# Altium schematic sheet ORing.SchDoc
size A4; SheetNumber: 2; SheetTotal: 7
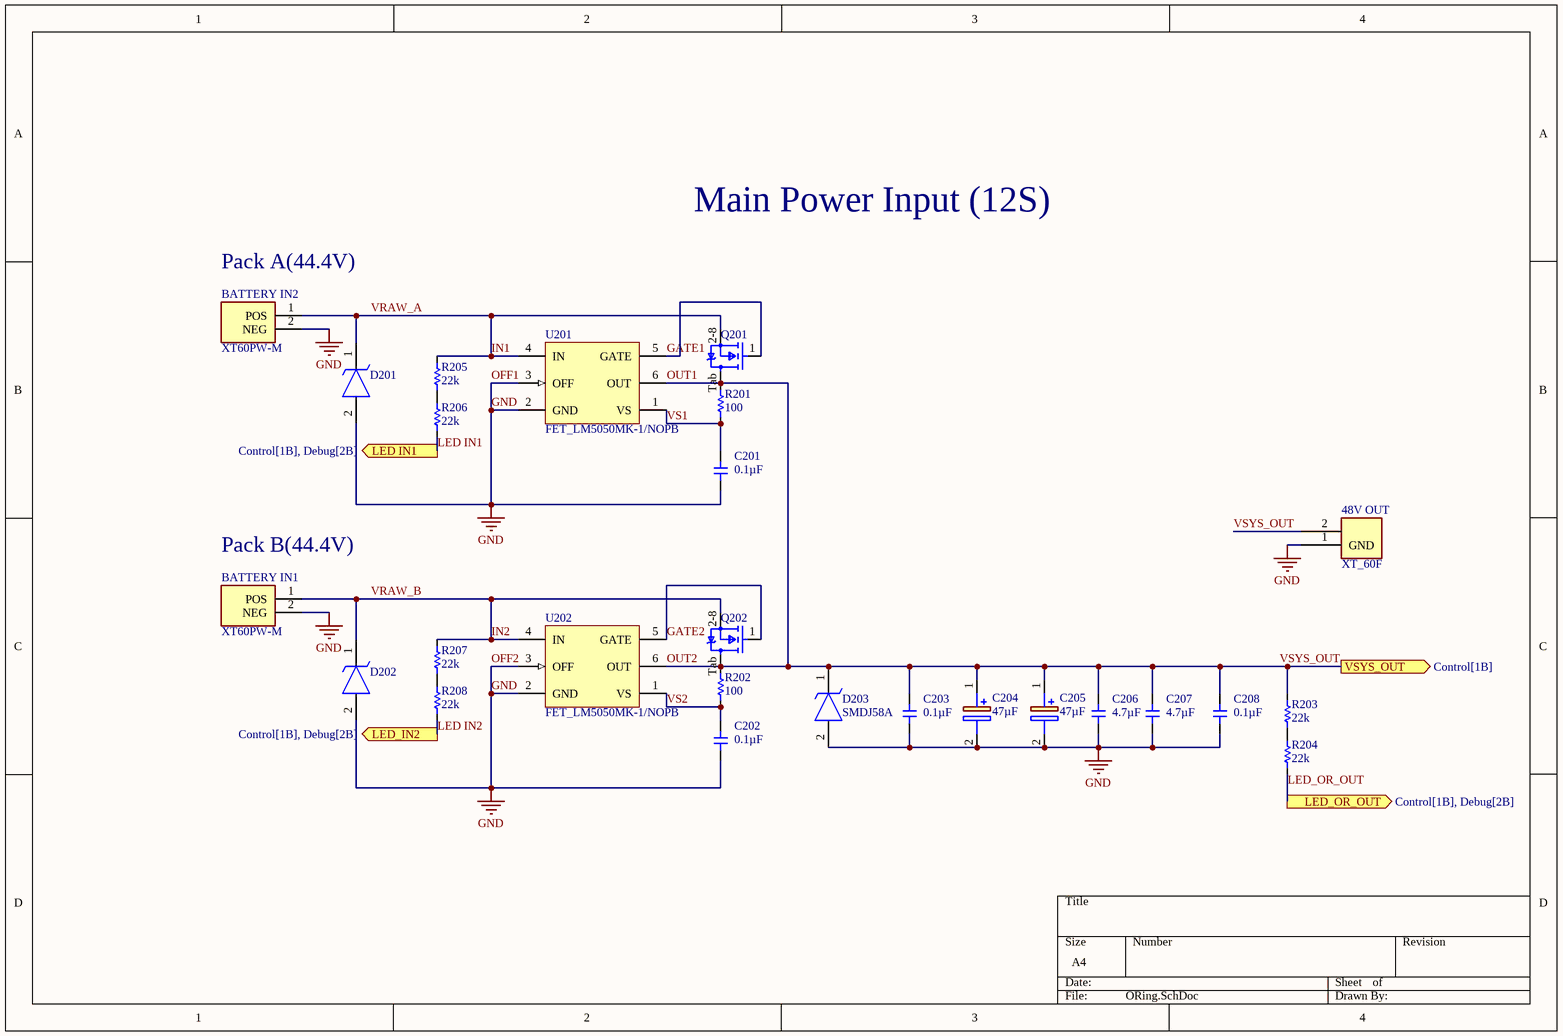
[diagram p0: ORing.SchDoc]

## Parts
48V_OUT  XT_60F  [XT60_F]
BATTERY_IN1  XT60PW-M  [XT60PW-M]
BATTERY_IN2  XT60PW-M  [XT60PW-M]
C201  Capacitance: 0.1µF  [C0603]  (hidden comment: C_0603_0P1UF_10P_100V_X7R)
C202  Capacitance: 0.1µF  [C0603]  (hidden comment: C_0603_0P1UF_10P_100V_X7R)
C203  Capacitance: 0.1µF  [C0603]  (hidden comment: C_0603_0P1UF_10P_100V_X7R)
C204  47µF  [CAPAE1030X1050N]
C205  47µF  [CAPAE1030X1050N]
C206  Capacitance: 4.7µF  [C1210]  (hidden comment: C_1210_4U7F_10P_100V_X7R)
C207  Capacitance: 4.7µF  [C1210]  (hidden comment: C_1210_4U7F_10P_100V_X7R)
C208  Capacitance: 0.1µF  [C0603]  (hidden comment: C_0603_0P1UF_10P_100V_X7R)
D201  SMDJ58A  [DIONM7959X262N]  (value not drawn)
D202  SMDJ58A  [DIONM7959X262N]  (value not drawn)
D203  SMDJ58A  [DIONM7959X262N]
Q201  Trans_Infineon_IPT015N10N5_eec  [Infineon_IPT015N10N5_0]  (value not drawn)
Q202  Trans_Infineon_IPT015N10N5_eec  [Infineon_IPT015N10N5_0]  (value not drawn)
R201  Resistance: 100  [R0603]  (hidden comment: R_0603_100R_1P_0P1W)
R202  Resistance: 100  [R0603]  (hidden comment: R_0603_100R_1P_0P1W)
R203  Resistance: 22k  [R0603]  (hidden comment: R_0603_22K_1P_0P1W)
R204  Resistance: 22k  [R0603]  (hidden comment: R_0603_22K_1P_0P1W)
R205  Resistance: 22k  [R0603]  (hidden comment: R_0603_22K_1P_0P1W)
R206  Resistance: 22k  [R0603]  (hidden comment: R_0603_22K_1P_0P1W)
R207  Resistance: 22k  [R0603]  (hidden comment: R_0603_22K_1P_0P1W)
R208  Resistance: 22k  [R0603]  (hidden comment: R_0603_22K_1P_0P1W)
U201  FET_LM5050MK-1/NOPB  [DDC0006A_M]
U202  FET_LM5050MK-1/NOPB  [DDC0006A_M]

## Ports
LED IN1 (out, see Control[1B], Debug[2B]), LED_IN2 (out, see Control[1B], Debug[2B]), LED_OR_OUT (out, see Control[1B], Debug[2B]), VSYS_OUT (out, see Control[1B])

## Nets
GND: 48V_OUT.1(GND) BATTERY_IN1.2(NEG) BATTERY_IN2.2(NEG) C201.1 C202.1 C203.1 C204.2(-) C205.2(-) C206.1 C207.1 C208.1 D201.2(A) D202.2(A) D203.2(A) U201.2(GND) U201.3(OFF) U202.2(GND) U202.3(OFF)  [also labelled OFF1, OFF2]
GATE1: Q201.1(Gate) U201.5(GATE)
GATE2: Q202.1(Gate) U202.5(GATE)
IN1: BATTERY_IN2.1(POS) D201.1(K) Q201.2-8(Source) R205.2 U201.4(IN)  [also labelled VRAW_A]
IN2: BATTERY_IN1.1(POS) D202.1(K) Q202.2-8(Source) R207.2 U202.4(IN)  [also labelled VRAW_B]
LED IN1: R206.1 ; port LED IN1
LED IN2: R208.1 ; port LED_IN2
LED_OR_OUT: R204.1 ; port LED_OR_OUT
OUT1: 48V_OUT.2 C203.2 C204.1(+) C205.1(+) C206.2 C207.2 C208.2 D203.1(K) Q201.Tab(Drain) Q202.Tab(Drain) R201.2 R202.2 R203.2 U201.6(OUT) U202.6(OUT) ; port VSYS_OUT  [also labelled OUT2, VSYS_OUT]
VS1: C201.2 R201.1 U201.1(VS)
VS2: C202.2 R202.1 U202.1(VS)
NetR203_1: R203.1 R204.2
NetR205_1: R205.1 R206.2
NetR207_1: R207.1 R208.2

## Notes on the sheet
- Main Power Input (12S)
- (near BATTERY_IN2) Pack A(44.4V)
- (near BATTERY_IN1) Pack B(44.4V)

## Library data of the parts
48V_OUT = CMP-019-000041-2: XT_60 Connector FEMAIL; Design Item ID: XT_60F; Source: robit_connector.SchLib; System: Connector
BATTERY_IN1 BATTERY_IN2 = CMP-019-000059-3: Socket, DC supply, male, PIN: 2; MF: AMASS; System: Connector; Package: Package; SnapEDA_Link: https://www.snapeda.com/parts/XT60PW-M/AMASS/view-part/?ref=snap; Design Item ID: XT60PW-M; Check_prices: https://www.snapeda.com/parts/XT60PW-M/AMASS/view-part/?ref=eda; MP: XT60PW-M; Price: None; Availability: Not in stock; Source: robit_connector.SchLib; Value: *
C201-C203 C208 = CMP-00021-3: MLCC, 0.1µF, 10%, 100V, X7R, 0603; Dielectric: X7R; Mounting Type: SMD; Tolerance: 10%; Package: 0603; Voltage Rating: 100V
C204 C205 = UUX2A470MNL1GS: Capacitor Polarised; Manufacturer_Name: Nichicon; Datasheet Link: https://componentsearchengine.com/Datasheets/1/UUX2A470MNL1GS.pdf; Height: 10.5mm; Manufacturer_Part_Number: UUX2A470MNL1GS; Mouser Part Number: 647-UUX2A470MNL1GS; Mouser Price/Stock: https://www.mouser.co.uk/ProductDetail/Nichicon/UUX2A470MNL1GS?qs=jZZh9D7uMhmPZMofMKn2Fg%3D%3D; Arrow Part Number: UUX2A470MNL1GS; Arrow Price/Stock: https://www.arrow.com/en/products/uux2a470mnl1gs/nichicon?utm_currency=USD&region=nac
C206 C207 = CMP-00065-1: MLCC, 4.7µF, 10%, 100V, X7R, 1210; Package: 1210; Tolerance: 10%; Dielectric: X7R; Voltage Rating: 100V; Mounting Type: SMD
D201-D203 = SMDJ58A: TVS Diode (Uni-directional); Manufacturer_Name: LITTELFUSE; Datasheet Link: https://mouser.componentsearchengine.com/Datasheets/2/SMDJ58A.pdf; Height: 2.62mm; Manufacturer_Part_Number: SMDJ58A; Mouser Part Number: 576-SMDJ58A; Mouser Price/Stock: https://www.mouser.co.uk/ProductDetail/Littelfuse/SMDJ58A?qs=zL8PTTxXkF2zAaoXCy3ytQ%3D%3D; Arrow Part Number: SMDJ58A; Arrow Price/Stock: https://www.arrow.com/en/products/smdj58a/littelfuse?utm_currency=USD&region=nac
Q201 Q202 = Trans_Infineon_IPT015N10N5_eec: TRANS MOSFET N-CH 100V 300A 8HSOF; Part Number: IPT015N10N5; helpURL: https://upverter.com/upn/revision/59ddb1136ed40b7f/; ComponentLink2Description: Datasheet; Temperature: -55°C to +175°C; Package: HSOF8; Supplier 2: Mouser; Supplier 1: Digi-Key; ComponentLink1URL: https://upverter.com/upn/revision/59ddb1136ed40b7f/; Supplier Part Number 2: 726-IPT015N10N5ATMA1; Supplier Part Number 1: IPT015N10N5ATMA1CT-ND; Manufacturer: Infineon; ComponentLink1Description: Upverter; ComponentLink2URL: http://www.infineon.com/dgdl/Infineon-IPT015N10N5-DS-v02_02-EN.pdf?fileId=5546d4624a75e5f1014ac94680661aff; RoHS: TRUE; Mouser Part Number: 726-IPT015N10N5ATMA1; Temperature Range High: +175°C; Digikey Description: TRANS MOSFET N-CH 100V 300A 8HSOF; Digikey Part Number: IPT015N10N5ATMA1CT-ND; Lead Free: yes; Temperature Range Low: -55°C
R201 R202 = CMP-00048-1: Chip resistor, 100 Ohm, 1%, 0.1W, 0603; Voltage Rating: 75V; Power Rating: 100mW; Tolerance: 1%; Mounting Type: SMD; Package: 0603
R203-R208 = CMP-00064-1: Chip resistor, 22k Ohm, 1%, 0.1W, 0603; Power Rating: 100mW; Voltage Rating: 75V; Tolerance: 1%; Mounting Type: SMD; Package: 0603
U201 U202 = CMP-026-000034-1: 5-V to 75-V 400-uA IQ ORing FET controller 6-SOT-23-THIN -40 to 125